# Altium schematic sheet [1] Page 1.SchDoc
size Letter; DocumentNumber: 1; SheetNumber: 1
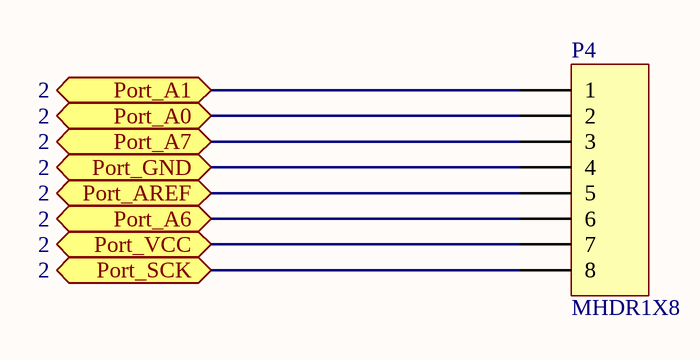
[diagram p0: [1] Page 1.SchDoc]

## Parts
P4  MHDR1X8  [MHDR1X8]

## Ports
Port_A0 (bidir, see 2), Port_A1 (bidir, see 2), Port_A6 (bidir, see 2), Port_A7 (bidir, see 2), Port_AREF (bidir, see 2), Port_GND (bidir, see 2), Port_SCK (bidir, see 2), Port_VCC (bidir, see 2)

## Nets
Port_A0: P4.2 ; port Port_A0
Port_A1: P4.1 ; port Port_A1
Port_A6: P4.6 ; port Port_A6
Port_A7: P4.3 ; port Port_A7
Port_AREF: P4.5 ; port Port_AREF
Port_GND: P4.4 ; port Port_GND
Port_SCK: P4.8 ; port Port_SCK
Port_VCC: P4.7 ; port Port_VCC

## Library data of the parts
P4 = MHDR1X8: Header, 8-Pin; LatestRevisionDate: 17-Jul-2002; LatestRevisionNote: Re-released for DXP Platform.; Publisher: Altium Limited